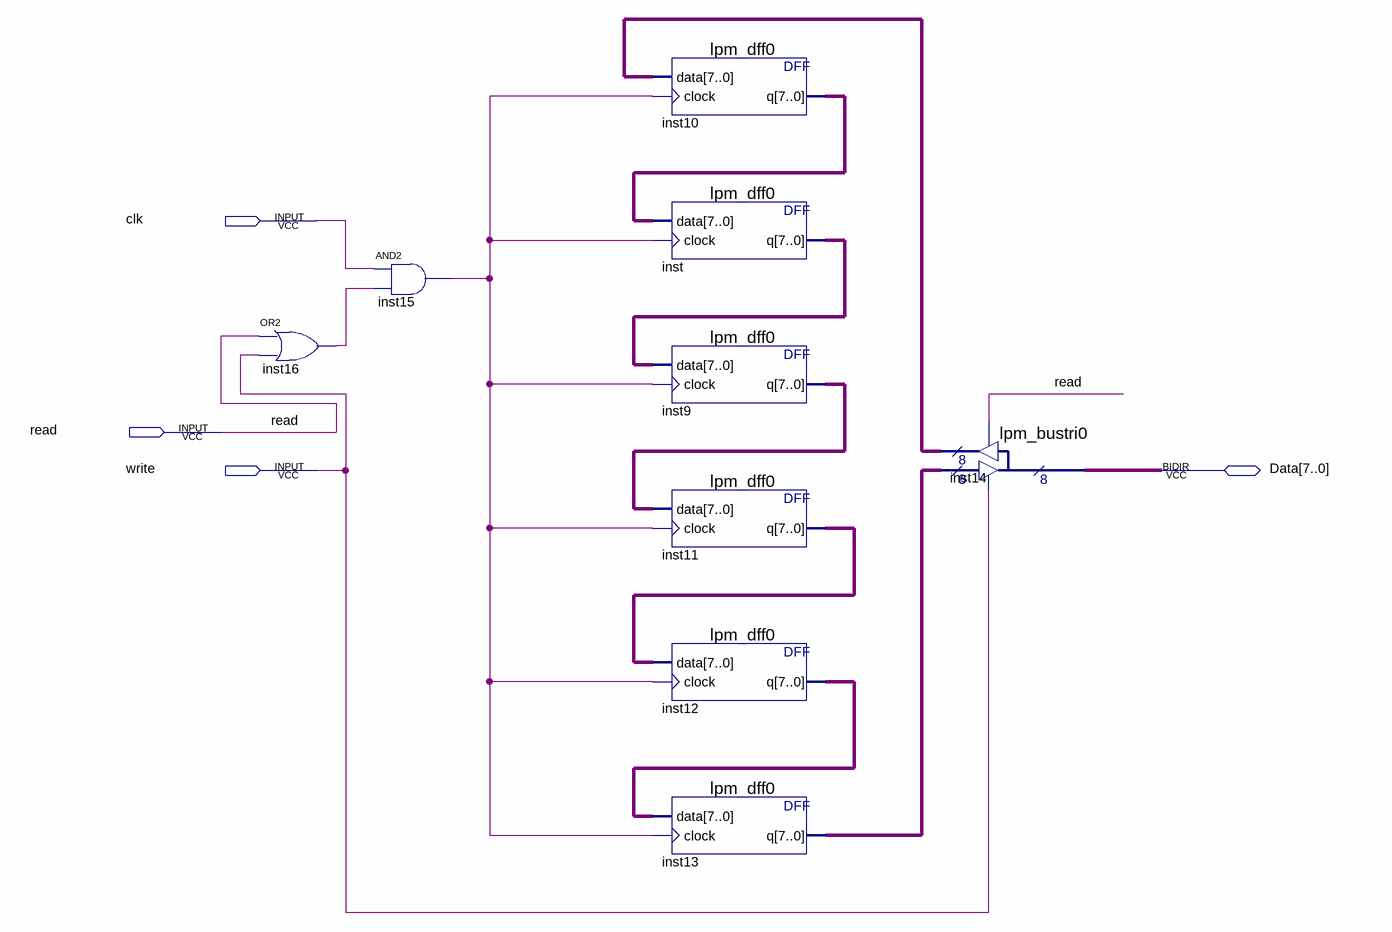
[diagram p0: schematic sheet]
// Quartus schematic buffer_6byte.bdf as structural Verilog: 9 symbols, 4 pins
module buffer_6byte (
  input  clk,
  input  read,
  input  write,
  inout  [7:0] Data
);

  wire inst15_out, inst16_out;
  wire [7:0] inst9_q, inst10_q, inst11_q, inst12_q, inst13_q, inst14_result, inst_q;

  or inst16 (inst16_out, read, write);
  and inst15 (inst15_out, clk, inst16_out);
  lpm_dff0 inst10 (.data(inst14_result), .clock(inst15_out), .q(inst10_q));
  lpm_dff0 inst (.data(inst10_q), .clock(inst15_out), .q(inst_q));
  lpm_dff0 inst9 (.data(inst_q), .clock(inst15_out), .q(inst9_q));
  lpm_dff0 inst11 (.data(inst9_q), .clock(inst15_out), .q(inst11_q));
  lpm_dff0 inst12 (.data(inst11_q), .clock(inst15_out), .q(inst12_q));
  lpm_dff0 inst13 (.data(inst12_q), .clock(inst15_out), .q(inst13_q));
  lpm_bustri0 inst14 (.enabledt(write), .data(inst13_q), .enabletr(read), .result(inst14_result), .tridata(Data));
endmodule
